# Altium schematic sheet Filters.SchDoc
size A4; SheetNumber: 4; SheetTotal: 9
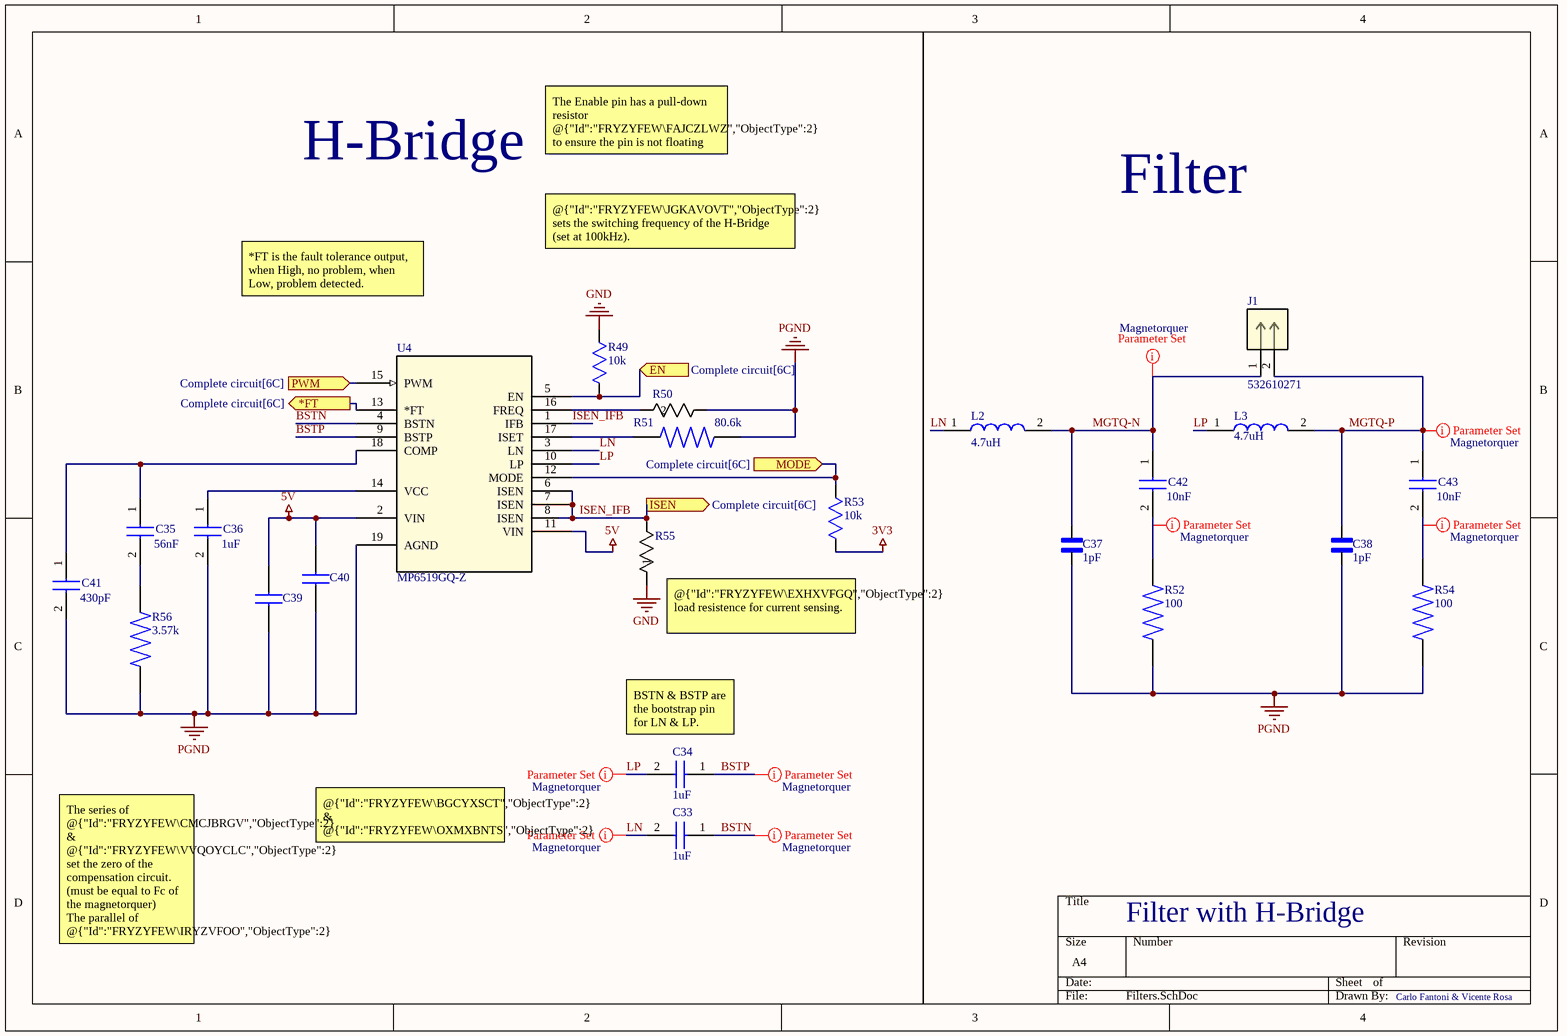
[diagram p0: Filters.SchDoc]

## Parts
C33  Capacitance: 1uF  [C0603]  (hidden comment: C0603X105K4RACAUTO7411)
C34  Capacitance: 1uF  [C0603]  (hidden comment: C0603X105K4RACAUTO7411)
C35  Capacitance: 56nF  [GCM31C5C2E183FX03L]  (hidden comment: GCM31M5C1H563GA16L)
C36  Capacitance: 1uF  [C0603]  (hidden comment: C0603X105K4RACAUTO7411)
C37  value 1pF  [CAPC1608X90]  (hidden comment: AC0603BRNPO9BN1R0)
C38  value 1pF  [CAPC1608X90]  (hidden comment: AC0603BRNPO9BN1R0)
C39  GCM31CR71A226KE02L  [CAPC3116X180N]  (value not drawn)
C40  GCM31CR71A226KE02L  [CAPC3116X180N]  (value not drawn)
C41  Capacitance: 430pF  [CAPC1608X90N]  (hidden comment: 06035C431JAT2A)
C42  Capacitance: 10nF  [CAPC1608X90N]  (hidden comment: 0603ZC103M4T2A)
C43  Capacitance: 10nF  [CAPC1608X90N]  (hidden comment: 0603ZC103M4T2A)
J1  532610271  [CONN_532610001-SD_02_MOL]
L2  Inductance: 4.7uH  [LQM2MPN1R0NG0L]  (hidden comment: LQM2MPZ4R7MG0L)
L3  Inductance: 4.7uH  [LQM2MPN1R0NG0L]  (hidden comment: LQM2MPZ4R7MG0L)
R49  value 10k  [RES_ERA3ARB103V]  (hidden comment: ERA3ARB103V)
R50  ERJ-6ENF2260V  [RC0805N_PAN]  (value not drawn)
R51  value 80.6k  [RES_ERJ3EKF8062V]  (hidden comment: ERJ3EKF8062V)
R52  value 100  [RESC2012X60N]  (hidden comment: CRCW0805100RFKEAHP)
R53  value 10k  [RES_ERA3ARB103V]  (hidden comment: ERA3ARB103V)
R54  value 100  [RESC2012X60N]  (hidden comment: CRCW0805100RFKEAHP)
R55  KDV06FR100ET  [RES_KDV06_OHM]  (value not drawn)
R56  value 3.57k  [RES_ERJPA3F3571V]  (hidden comment: ERJPA3F3571V)
U4  MP6519GQ-Z  [QFN-3x3_MP6519_MNP]

## Ports
*FT (out, see Complete circuit[6C]), EN (in, see Complete circuit[6C]), ISEN (out, see Complete circuit[6C]), MODE (in, see Complete circuit[6C]), PWM (in, see Complete circuit[6C])

## Nets
3V3: R53.1
5V: C39.2 C40.2 U4.2(VIN) U4.11(VIN)
GND: R49.2 R55.1
PGND: C36.2 C37.2 C38.2 C39.1 C40.1 C41.2 R50.1 R51.2 R52.1 R54.1 R56.1 U4.19(AGND)
*FT: U4.13(*FT) ; port *FT
BSTN: C33.1 U4.4(BSTN)
BSTP: C34.1 U4.9(BSTP)
EN: R49.1 U4.5(EN) ; port EN
ISEN_IFB: R55.2 U4.1(IFB) U4.6(ISEN) U4.7(ISEN) U4.8(ISEN) ; port ISEN
LN: C33.2 L2.1 U4.3(LN)
LP: C34.2 L3.1 U4.10(LP)
MGTQ-N: C37.1 C42.1 J1.1 L2.2
MGTQ-P: C38.1 C43.1 J1.2 L3.2
MODE: R53.2 U4.12(MODE) ; port MODE
PWM: U4.15(PWM) ; port PWM
NetC35_1: C35.1 C41.1 U4.18(COMP)
NetC35_2: C35.2 R56.2
NetC36_1: C36.1 U4.14(VCC)
NetC42_2: C42.2 R52.2
NetC43_2: C43.2 R54.2
NetR50_2: R50.2 U4.16(FREQ)
NetR51_1: R51.1 U4.17(ISET)

## Layout directives
net class Magnetorquer: BSTN, BSTP, LN, LP, MGTQ-N, MGTQ-P, NetC42_2, NetC43_2

## Notes on the sheet
- H-Bridge
- The Enable pin has a pull-down resistor @{"Id":"FRYZYFEW\FAJCZLWZ","ObjectType":2} to ensure the pin is not floating and control the functioning.
- @{"Id":"FRYZYFEW\JGKAVOVT","ObjectType":2} sets the switching frequency of the H-Bridge (set at 100kHz).
  @{"Id":"FRYZYFEW\IHANNGST","ObjectType":2} sets the maximum output current (1.1A).
- Filter
- *FT is the fault tolerance output, when High, no problem, when Low, problem detected.
- (near R55) @{"Id":"FRYZYFEW\EXHXVFGQ","ObjectType":2} load resistence for current sensing.
- (near C34) BSTN & BSTP are the bootstrap pin for LN & LP.
- @{"Id":"FRYZYFEW\BGCYXSCT","ObjectType":2} & @{"Id":"FRYZYFEW\OXMXBNTS","ObjectType":2} decoupling capacitors for VIN.
  @{"Id":"FRYZYFEW\CWQAZVTG","ObjectType":2} same function for VCC.
- Filter with H-Bridge
- The series of @{"Id":"FRYZYFEW\CMCJBRGV","ObjectType":2} & @{"Id":"FRYZYFEW\VVQOYCLC","ObjectType":2} set the zero of the compensation circuit. (must be equal to Fc of the magnetorquer)
  The parallel of @{"Id":"FRYZYFEW\IRYZVFOO","ObjectType":2} and ( @{"Id":"FRYZYFEW\CMCJBRGV","ObjectType":2} & @{"Id":"FRYZYFEW\VVQOYCLC","ObjectType":2} ) gives the pole, that must equal the switching frequency.
- Carlo Fantoni & Vicente Rosa

## Library data of the parts
C33 C34 C36 = C0603X105K4RACAUTO7411: Multilayer Ceramic Capacitors MLCC - SMD/SMT 16 Vol 1 uF 0603 X7R 10 % AECQ200; Manufacturer_Name: Yageo Group; Datasheet Link: https://content.kemet.com/datasheets/KEM_C1078_X7R_FT-CAP_AUTO_SMD.pdf; Height: 0.87mm; Manufacturer_Part_Number: C0603X105K4RACAUTO7411; Mouser Part Number: 80-C0603X105K4RAUTLR; Mouser Price/Stock: https://www.mouser.co.uk/ProductDetail/KEMET/C0603X105K4RACAUTO7411?qs=55YtniHzbhCFXoL%252B6qNZhA%3D%3D; Arrow Part Number: C0603X105K4RACAUTO7411; Arrow Price/Stock: https://www.arrow.com/en/products/c0603x105k4racauto7411/kemet-corporation
C35 = GCM31M5C1H563GA16L: Multilayer Ceramic Capacitors MLCC - SMD/SMT 0.056 uF 50 VDC 2% 1206 C0G (NP0) AEC-Q200; Manufacturer_Name: Murata Electronics; Datasheet Link: https://search.murata.co.jp/Ceramy/image/img/A01X/G101/ENG/GCM31M5C1H563GA16-01A.pdf; Height: 1.25mm; Manufacturer_Part_Number: GCM31M5C1H563GA16L; Mouser Part Number: 81-GCM31M5C1H563GA6L; Mouser Price/Stock: https://www.mouser.co.uk/ProductDetail/Murata-Electronics/GCM31M5C1H563GA16L?qs=QzBtWTOodeXHyUqaFogeLg%3D%3D
C37 C38 = CMP-001-00134-1: 1 pF Â±0.1pF 50V Ceramic Capacitor C0G, NP0 0603 (1608 Metric); MF: Yageo; Check_prices: https://www.snapeda.com/parts/AC0603BRNPO9BN1R0/Yageo/view-part/?ref=eda; Component Type: Standard; SnapEDA_Link: https://www.snapeda.com/parts/AC0603BRNPO9BN1R0/Yageo/view-part/?ref=snap; Case/Package: 0603 Yageo; MP: AC0603BRNPO9BN1R0; Design Item ID: AC0603BRNPO9BN1R0; Source: AC0603BRNPO9BN1R0.SchLib; Pins: 2
C39 C40 = CMP-001-00127-1: Capacitor GCM31 L=3.2mm W=1.6mm T=1.6mm; Manufacturer_Name: Murata Electronics; Geometry.Height: 1.8mm; Mouser Price/Stock: https://www.mouser.co.uk/ProductDetail/Murata-Electronics/GCM31CR71A226KE02L?qs=9UHcxq0qN4vtutbd1jidnA%3D%3D; Source: GCM31CR71A226KE02L.SchLib; Datasheet Link: https://search.murata.co.jp/Ceramy/image/img/A01X/G101/ENG/GCM31CR71A226KE02-01A.pdf; Design Item ID: GCM31CR71A226KE02L; Manufacturer_Part_Number: GCM31CR71A226KE02L; Mouser Part Number: 81-GCM31CR71A226KE2L
C41 = 06035C431JAT2A: 430 pF Â±5% 50V Ceramic Capacitor X7R 0603 (1608 Metric); Manufacturer_Name: Kyocera AVX; Datasheet Link: https://componentsearchengine.com/Datasheets/1/06031A100FAT2A.pdf; Height: 0.9mm; Manufacturer_Part_Number: 06035C431JAT2A; Mouser Part Number: 581-06035C431JAT2A; Mouser Price/Stock: https://www.mouser.co.uk/ProductDetail/AVX/06035C431JAT2A?qs=qVfB0%2FDaMDZVRmf5AEZuTw%3D%3D
C42 C43 = 0603ZC103M4T2A: Capacitor; Manufacturer_Name: Kyocera AVX; Datasheet Link: https://componentsearchengine.com/Datasheets/1/06031A100FAT2A.pdf; Height: 0.9mm; Manufacturer_Part_Number: 0603ZC103M4T2A; Mouser Part Number: 581-0603ZC103M4T2A; Mouser Price/Stock: https://www.mouser.com/Search/Refine.aspx?Keyword=581-0603ZC103M4T2A
J1 = 532610271: 1.25mm Pitch, PicoBlade PCB Header, Single Row, Right-Angle, Surface Mount, Tin (Sn) Plating, Friction Lock, 2 Circuits, Natural, Tape and Reel; Manufacturer_Name: Molex Connector Corporation; Copyright: Copyright (C) 2025 Ultra Librarian. All rights reserved.; Manufacturer_Part_Number: 532610271; RefDes: RefDes; Type: Type
L2 L3 = LQM2MPZ4R7MG0L: FIXED IND 4.7UH 1.1A 175 MOHM; Manufacturer_Name: Murata Electronics; Datasheet Link: https://search.murata.co.jp/Ceramy/image/img/P02/JELF243B-9109.pdf; Height: 1mm; Manufacturer_Part_Number: LQM2MPZ4R7MG0L; Mouser Part Number: 81-LQM2MPZ4R7MG0L; Mouser Price/Stock: https://www.mouser.com/Search/Refine.aspx?Keyword=81-LQM2MPZ4R7MG0L
R49 R53 = CMP-009-00245-3: Thin Film Resistors - SMD 0603 10Kohm 0.1% 10ppm AEC-Q200; Design Item ID: ERA3ARB103V; Case/Package: None; Pins: 2; Source: ERA3ARB103V.SchLib; Component Type: Standard; MP: ERA3ARB103V; Availability: Unavailable; Price: None
R50 = ERJ-6ENF2260V: No Description Available; Manufacturer_Name: Panasonic; Copyright: Copyright (C) 2026 Ultra Librarian. All rights reserved.; Manufacturer_Part_Number: ERJ-6ENF2260V
R51 = CMP-009-00255-1: 80.6 kOhms 1% 0.1W, 1/10W Chip Resistor 0603 (1608 Metric) Automotive AEC-Q200 Thick Film; MF: Panasonic; MP: ERJ-3EKF8062V; SnapEDA_Link: https://www.snapeda.com/parts/ERJ-3EKF8062V/Panasonic+Electronic+Components/view-part/?ref=snap; Design Item ID: ERJ3EKF8062V; Case/Package: 1608-2 Panasonic; Pins: 2; Component Type: Standard; Source: ERJ3EKF8062V.SchLib; Check_prices: https://www.snapeda.com/parts/ERJ-3EKF8062V/Panasonic+Electronic+Components/view-part/?ref=eda
R52 R54 = CMP-009-00256-1: Resistor;Thick Film;100 Ohms;0.33 W;1%;SMT;0805;TCR 37 ppm/DegC; MF: Vishay; Design Item ID: CRCW0805100RFKEAHP; Component Type: Standard; MP: CRCW0805100RFKEAHP; Check_prices: https://www.snapeda.com/parts/CRCW0805100RFKEAHP/Vishay+Dale/view-part/?ref=eda; SnapEDA_Link: https://www.snapeda.com/parts/CRCW0805100RFKEAHP/Vishay+Dale/view-part/?ref=snap; Pins: 2; Source: CRCW0805100RFKEAHP.SchLib; Case/Package: 2012 Bourns
R55 = KDV06FR100ET: No Description Available; Manufacturer_Name: Ohmite; Copyright: Copyright (C) 2026 Ultra Librarian. All rights reserved.; Manufacturer_Part_Number: KDV06FR100ET
R56 = CMP-009-00253-1: RES SMD 3.57K OHM 1% 1/4W 0603; MP: ERJ-PA3F3571V; MF: Panasonic; Design Item ID: ERJPA3F3571V; Check_prices: https://www.snapeda.com/parts/ERJ-PA3F3571V/Panasonic/view-part/?ref=eda; Component Type: Standard; SnapEDA_Link: https://www.snapeda.com/parts/ERJ-PA3F3571V/Panasonic/view-part/?ref=snap; Source: ERJPA3F3571V.SchLib; Case/Package: 1608-2 Panasonic; Pins: 2
U4 = MP6519GQ-Z: 2.5V - 28V 5A H-Bridge Current Regulator; Manufacturer_Name: Monolithic Power Systems; Copyright: Copyright (C) 2026 Ultra Librarian. All rights reserved.; Manufacturer_Part_Number: MP6519GQ-Z; RefDes: RefDes; Type: Type